# Altium schematic sheet OBD_II_Connector.SchDoc
size A; Author: Jared Ainsworth; CompanyName: UpRev LLC; Engineer: Jared Ainsworth; Organization: UpRev LLC; Address1: 4807 Commercial Park Dr.; Address2: Austin, TX 78724; Address3: United States; Address4: www.UpRev.com; SheetNumber: 5; SheetTotal: 13
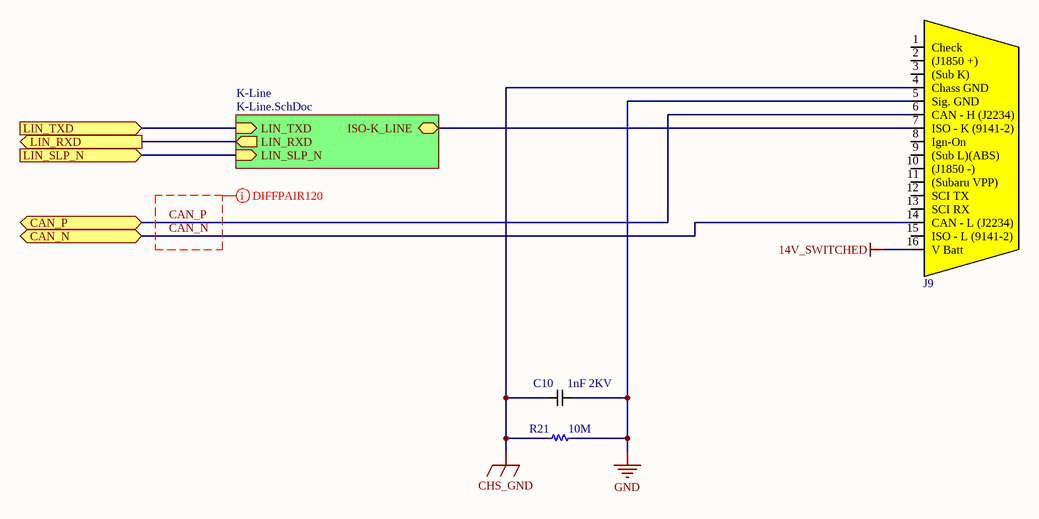
[diagram p0: OBD_II_Connector.SchDoc]

## Parts
C10  1nF 2KV  [C1206 (3216)]
J9  16 Pos J1962F Female OBDII Connector  [Connector 16 Pos J1962F Female OBDII Connector]  (value not drawn)  (no BOM)
R21  10M  [R0805 (2012), TIGHT]

## Sub-sheets
K-Line = K-Line.SchDoc: LIN_TXD (in), LIN_RXD (out), LIN_SLP_N (in), ISO-K_LINE (bidir)

## Ports
CAN_N (bidir, see Top_Level[2C], Dev_Board_Connection[1C]), CAN_P (bidir, see Top_Level[2C], Dev_Board_Connection[1C]), LIN_RXD (out, see Top_Level[2B], Dev_Board_Connection[3B], K-Line[1B]), LIN_SLP_N (in, see Top_Level[2B], Dev_Board_Connection[2B], K-Line[1B]), LIN_TXD (in, see Top_Level[2B], Dev_Board_Connection[2B], K-Line[1C])

## Nets
14V_SWITCHED: J9.16(V_Batt)
CHS_GND: C10.1 J9.4(Chass_GND) R21.1
GND: C10.2 J9.5(Sig._GND) R21.2
CAN_N: J9.14(CAN_-_L_(J2234)) ; port CAN_N
CAN_P: J9.6(CAN_-_H_(J2234)) ; port CAN_P
LIN_RXD: port LIN_RXD, sheet K-Line/LIN_RXD
LIN_SLP_N: port LIN_SLP_N, sheet K-Line/LIN_SLP_N
LIN_TXD: port LIN_TXD, sheet K-Line/LIN_TXD
NetJ9_7: J9.7(ISO_-_K_(9141-2)) ; sheet K-Line/ISO-K_LINE

Not connected (* = marked no-connect by the designer): J9 1(Check) 2((J1850_+)) 3((Sub_K)) 8(Ign-On) 9((Sub_L)(ABS)) 10((J1850_-)) 11((Subaru_VPP)) 12(SCI_TX) 13(SCI_RX) 15(ISO_-_L_(9141-2))

## Layout directives
differential pair; differential pair class CANBUS: CAN_N, CAN_P

## Notes on the sheet
- Title
- Size:
- Engineer:
- A
- Number:
- Revision:
- Sheet
- of
- File:

## Library data of the parts
C10 = 1nF Ceramic, 2KV, X7R, 1206 (3216): 1nF Ceramic Capacitor, 2KV, X7R, ±10%, 1206 (3216); Manufacturer Part Number: CC1206KKX7RDBB102; Manufacturer: YAGEO; Package: 1206 (3216 metric); Value: 1nF 2KV; LCSC Part Number: C23631
J9 = 16 Pos J1962F Female OBDII Connector: Vendor: Nemalyn Segura <nemalyn@autotestaid.com>
R21 = 10M ohm, 0805 (2012): 10M ohm, Resistor, ±1%, 0805 (2012); Manufacturer: UNI-ROYAL(Uniroyal Elec); Manufacturer Part Number: 0805W8F1005T5E; Package: 0805 (2012 metric); LCSC Part Number: C26108; Value: 10M